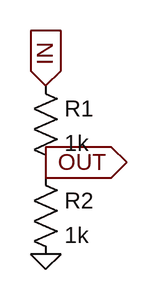
[diagram p0: schematic hier_amp.asc]
hier_amp.asc, the LTspice schematic file:
Version 4
SHEET 1 880 680
WIRE 0 96 0 112
FLAG 0 16 IN
IOPIN 0 16 In
FLAG 0 96 OUT
IOPIN 0 96 Out
FLAG 0 192 0
SYMBOL res -16 0 R0
SYMATTR InstName R1
SYMATTR Value 1k
SYMBOL res -16 96 R0
SYMATTR InstName R2
SYMATTR Value 1k

The netlist it stands for:
* hier_amp.asc
R1 IN OUT 1k
R2 OUT 0 1k
.backanno
.end